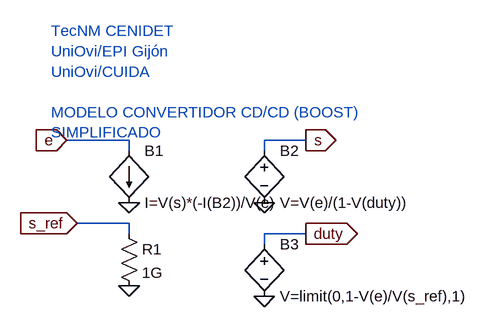
[diagram p0: schematic modelo_cc_cc_boost.asc]
modelo_cc_cc_boost.asc, the LTspice schematic file:
Version 4.1
SHEET 1 1452 740
WIRE 0 -48 -96 -48
WIRE 272 -48 208 -48
WIRE 0 -32 0 -48
WIRE 208 -32 208 -48
WIRE 0 80 -80 80
WIRE 0 96 0 80
WIRE 272 96 208 96
WIRE 208 112 208 96
FLAG -80 80 s_ref
IOPIN -80 80 In
FLAG 0 176 0
FLAG -96 -48 e
IOPIN -96 -48 In
FLAG 0 48 0
FLAG 272 -48 s
IOPIN 272 -48 Out
FLAG 208 48 0
FLAG 272 96 duty
IOPIN 272 96 Out
FLAG 208 192 0
SYMBOL res -16 80 R0
SYMATTR InstName R1
SYMATTR Value 1G
SYMBOL bi 0 -32 R0
SYMATTR InstName B1
SYMATTR Value I=V(s)*(-I(B2))/V(e)
SYMBOL bv 208 -48 R0
SYMATTR InstName B2
SYMATTR Value V=V(e)/(1-V(duty))
SYMBOL bv 208 96 R0
SYMATTR InstName B3
SYMATTR Value V=limit(0,1-V(e)/V(s_ref),1)
TEXT -120 -216 Left 2 ;TecNM CENIDET\nUniOvi/EPI Gijón\nUniOvi/CUIDA\n \nMODELO CONVERTIDOR CD/CD (BOOST)\nSIMPLIFICADO

The netlist it stands for:
* modelo_cc_cc_boost.asc
R1 s_ref 0 1G
B1 e 0 I=V(s)*(-I(B2))/V(e)
B2 s 0 V=V(e)/(1-V(duty))
B3 duty 0 V=limit(0,1-V(e)/V(s_ref),1)
* TecNM CENIDET
* UniOvi/EPI Gijón
* UniOvi/CUIDA
* MODELO CONVERTIDOR CD/CD (BOOST)
* SIMPLIFICADO
.backanno
.end